# Altium schematic sheet USB_Communication.SchDoc: BYTE SPIne - USB-C & 4-Port Hub
size A4; DocumentNumber: BYTE-SPINE-03; SheetNumber: 3; SheetTotal: 3; LCSC: C165948
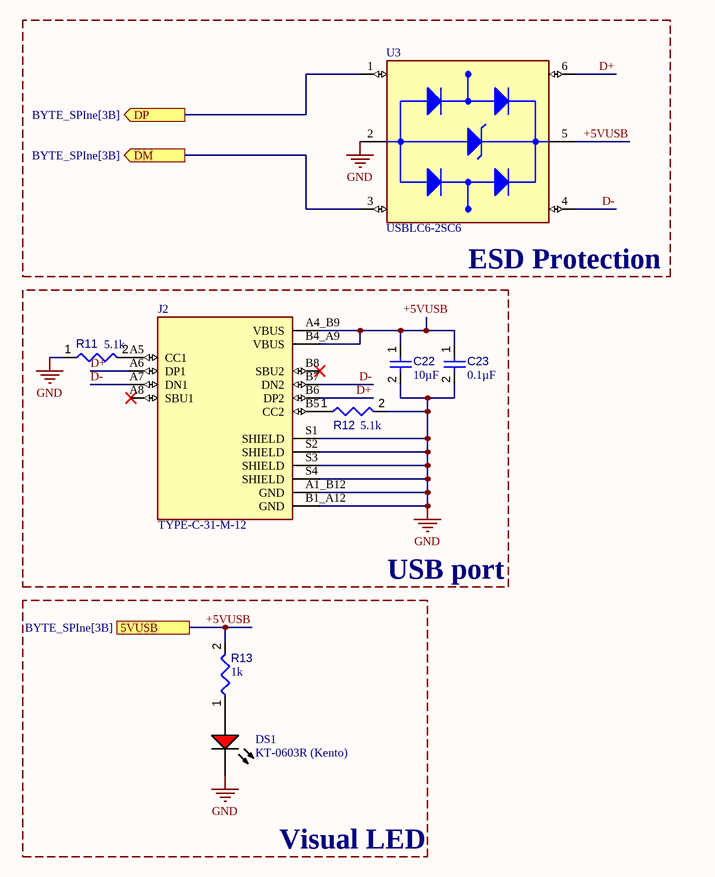
[diagram p0: USB_Communication.SchDoc]

## Parts
C22  value 10µF  [CAPC0603(1608)100_L]  (hidden comment: 10uF)
C23  value 0.1µF  [CAPC0603(1608)100_L]  (hidden comment: 100nF)
DS1  KT-0603R (Kento)  [AVAG-HSMX-C190_V]
J2  TYPE-C-31-M-12  [HRO_TYPE-C-31-M-12]
R11  5.1k  [RESC1608X55X25ML10T15]
R12  5.1k  [RESC1608X55X25ML10T15]
R13  1k  [RESC1608X55X25ML10T15]
U3  USBLC6-2SC6  [SOT95P280X145-6N]

## Blocks framed on the sheet
ESD Protection: U3

## Ports
5VUSB (see BYTE_SPIne[3B]), DM (out, see BYTE_SPIne[3B]), DP (out, see BYTE_SPIne[3B])

## Nets
GND: C22.2 C23.2 DS1.2(K) J2.A1_B12(GND) J2.B1_A12(GND) J2.S1(SHIELD) J2.S2(SHIELD) J2.S3(SHIELD) J2.S4(SHIELD) R11.1 R12.2 U3.2(GND)
+5VUSB: C22.1 C23.1 J2.A4_B9(VBUS) J2.B4_A9(VBUS) R13.2 U3.5(VBUS) ; port 5VUSB
D+: J2.A6(DP1) J2.B6(DP2) U3.6(I/O1_OUT)
D-: J2.A7(DN1) J2.B7(DN2) U3.4(I/O2_OUT)
DM: U3.3(I/O2_IN) ; port DM
DP: U3.1(I/O1_IN) ; port DP
NetDS1_1: DS1.1(A) R13.1
NetJ2_A5: J2.A5(CC1) R11.2
NetJ2_B5: J2.B5(CC2) R12.1

Not connected (* = marked no-connect by the designer): J2 A8(SBU1)* B8(SBU2)*

## Notes on the sheet
- USB port
- Visual LED

## Library data of the parts
C22 C23 = CMP-001-00075-4: 0603; Voltage Rating: 10V; Tolerance: 10%; Max Operating Temperature: 85°C; Pins: 2; Case/Package: 0603; Mounting Technology: SMT; Min Operating Temperature: -55°C
  C22: LCSC: C19702
  C23: LCSC: C14663
DS1 = CMP-007-00014-2: Manufacturer: Avago; Colour: Red; Nominal Vf: 1.8V; Luminous Intensity: 17mcd; Power: 78mW; Forward Current: 20mA; Lens Style: Diffused; Viewing Angle: 170degrees; Package Quantity: 4000; Manufacturer URL: http://www.avagotech.com/; Min Operating Temperature: -40°C; Datasheet URL: http://docs.avagotech.com/docs/AV02-0551EN; RoHS Compliant: True; Forward Voltage: 1.8V; Pins: 2; Max Operating Temperature: 85°C; Packaging: TapeandReel; Package Reference: HSMX-C190; Datasheet Version: Mar-12; Package Description: 2-Pin Surface Mount Device, Body 1.6 x 0.8 mm, Height 0.9 mm; Case/Package: 0603; Mounting Technology: SM; Illumination Colour: Red; LCSC: C2286
J2 = TYPE-C-31-M-12: USB Connectors 24 Receptacle 1 8.94*7.3mm RoHS; MF: HRO Electronics Co., Ltd.; SnapEDA_Link: https://www.snapeda.com/parts/TYPE-C-31-M-12/HRO+Electronics+Co.%252C+Ltd./view-part/?ref=snap; Package: Package; Value: *; MP: TYPE-C-31-M-12; Check_prices: https://www.snapeda.com/parts/TYPE-C-31-M-12/HRO+Electronics+Co.%252C+Ltd./view-part/?ref=eda
R11-R13 = CMP-009-00031-5: 0603; Tolerance: 1%; Power: 100mW; Mounting Technology: SM; Case/Package: 0603; RoHS Compliant: True; Pins: 2; Min Operating Temperature: -55°C; Max Operating Temperature: 155°C
  R11 R12: Value: 5.1k; LCSC: C23186
  R13: Value: 1k; LCSC: C21190
U3 = USBLC6-2SC6: 17V Clamp 5A (8/20Âµs) Ipp Tvs Diode Surface Mount SOT-23-6; MF: STMicroelectronics; Value: *; SnapEDA_Link: https://www.snapeda.com/parts/USBLC6-2SC6/STMicroelectronics/view-part/?ref=snap; Check_prices: https://www.snapeda.com/parts/USBLC6-2SC6/STMicroelectronics/view-part/?ref=eda; Purchase-URL: https://pricing.snapeda.com/search/part/USBLC6-2SC6/?ref=eda; Price: None; Availability: In Stock; Package: SOT-23-6 STMicroelectronics; MP: USBLC6-2SC6; LCSC: C7519